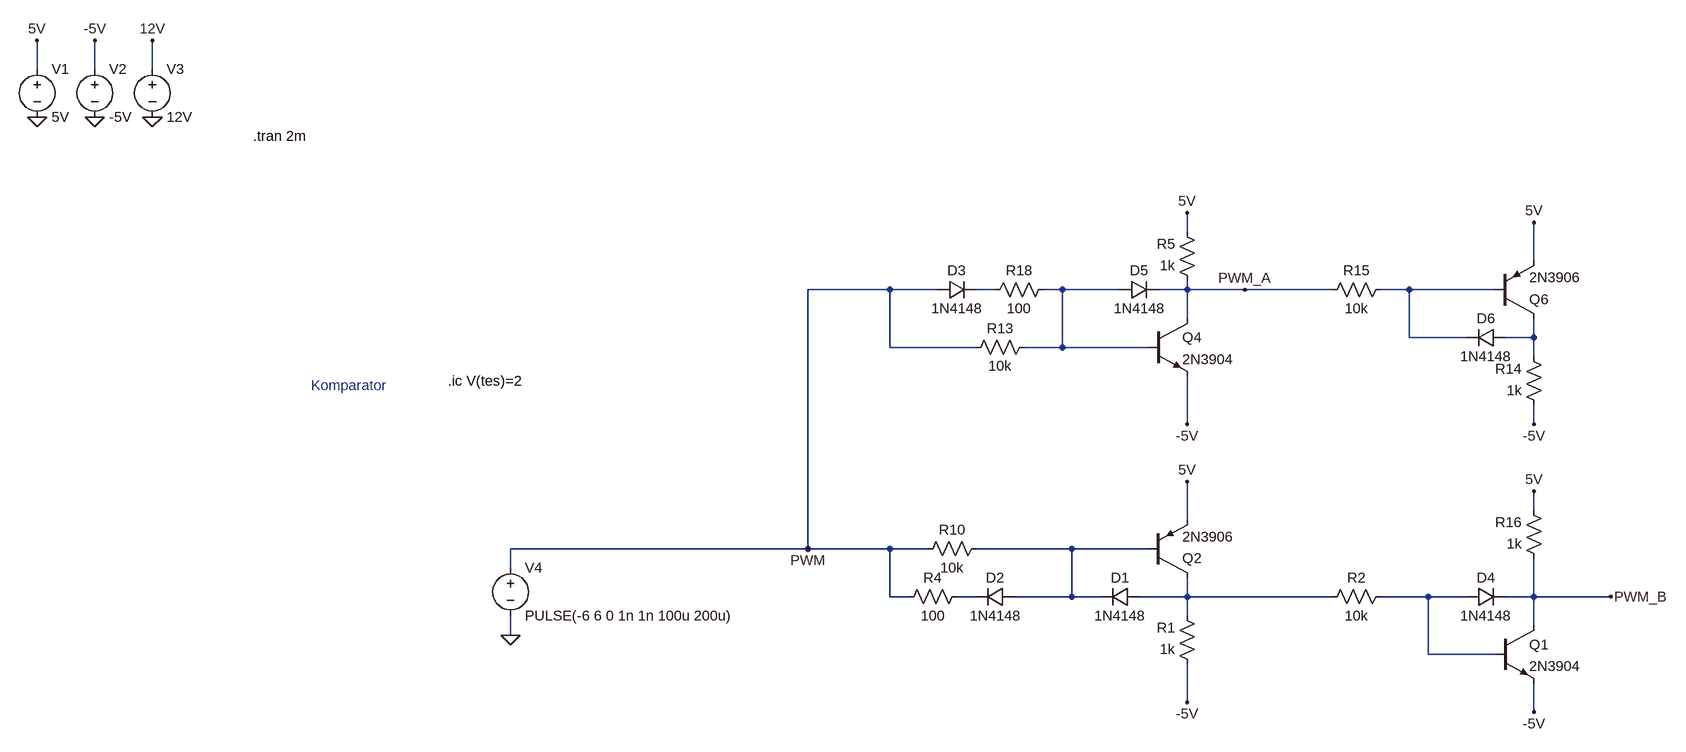
[diagram p0: schematic gate_drivers.asc]
gate_drivers.asc, the LTspice schematic file:
Version 4
SHEET 1 6380 2180
WIRE -1152 -816 -1152 -864
WIRE -1056 -816 -1056 -864
WIRE -960 -816 -960 -864
WIRE 1632 -544 1632 -576
WIRE 2320 -496 2320 -560
WIRE 1136 -448 880 -448
WIRE 1216 -448 1136 -448
WIRE 1312 -448 1280 -448
WIRE 1424 -448 1392 -448
WIRE 1520 -448 1424 -448
WIRE 1632 -448 1632 -464
WIRE 1632 -448 1584 -448
WIRE 1728 -448 1632 -448
WIRE 1984 -448 1728 -448
WIRE 2112 -448 2064 -448
WIRE 2256 -448 2112 -448
WIRE 1632 -400 1632 -448
WIRE 2112 -368 2112 -448
WIRE 2208 -368 2112 -368
WIRE 2320 -368 2320 -400
WIRE 2320 -368 2272 -368
WIRE 1136 -352 1136 -448
WIRE 1280 -352 1136 -352
WIRE 1424 -352 1424 -448
WIRE 1424 -352 1360 -352
WIRE 1568 -352 1424 -352
WIRE 2320 -336 2320 -368
WIRE 1632 -224 1632 -304
WIRE 2320 -224 2320 -256
WIRE 2320 -80 2320 -112
WIRE 1632 -64 1632 -128
WIRE 880 -16 880 -448
WIRE 880 -16 384 -16
WIRE 1136 -16 880 -16
WIRE 1200 -16 1136 -16
WIRE 1440 -16 1280 -16
WIRE 1568 -16 1440 -16
WIRE 384 16 384 -16
WIRE 1136 64 1136 -16
WIRE 1168 64 1136 64
WIRE 1280 64 1248 64
WIRE 1440 64 1440 -16
WIRE 1440 64 1344 64
WIRE 1488 64 1440 64
WIRE 1632 64 1632 32
WIRE 1632 64 1552 64
WIRE 1984 64 1632 64
WIRE 2144 64 2064 64
WIRE 2208 64 2144 64
WIRE 2320 64 2320 0
WIRE 2320 64 2272 64
WIRE 2448 64 2320 64
WIRE 1632 96 1632 64
WIRE 2320 112 2320 64
WIRE 384 128 384 96
WIRE 2144 160 2144 64
WIRE 2256 160 2144 160
WIRE 1632 240 1632 176
WIRE 2320 256 2320 208
FLAG -1152 -736 0
FLAG -1152 -864 5V
FLAG -1056 -736 0
FLAG -1056 -864 -5V
FLAG -960 -736 0
FLAG -960 -864 12V
FLAG 2448 64 PWM_B
FLAG 880 -16 PWM
FLAG 2320 256 -5V
FLAG 2320 -112 5V
FLAG 1632 -224 -5V
FLAG 1632 -576 5V
FLAG 2320 -224 -5V
FLAG 2320 -560 5V
FLAG 1632 240 -5V
FLAG 1632 -128 5V
FLAG 1728 -448 PWM_A
FLAG 384 128 0
SYMBOL voltage -1152 -832 R0
WINDOW 123 0 0 Left 0
WINDOW 39 0 0 Left 0
SYMATTR InstName V1
SYMATTR Value 5V
SYMBOL voltage -1056 -832 R0
WINDOW 123 0 0 Left 0
WINDOW 39 0 0 Left 0
SYMATTR InstName V2
SYMATTR Value -5V
SYMBOL voltage -960 -832 R0
WINDOW 123 0 0 Left 0
WINDOW 39 0 0 Left 0
SYMATTR InstName V3
SYMATTR Value 12V
SYMBOL npn 2256 112 R0
SYMATTR InstName Q1
SYMATTR Value 2N3904
SYMBOL res 1296 -32 R90
WINDOW 0 0 56 VBottom 2
WINDOW 3 32 56 VTop 2
SYMATTR InstName R10
SYMATTR Value 10k
SYMBOL res 2336 16 R180
WINDOW 0 36 76 Left 2
WINDOW 3 36 40 Left 2
SYMATTR InstName R16
SYMATTR Value 1k
SYMBOL diode 1344 48 R90
WINDOW 0 0 32 VBottom 2
WINDOW 3 32 32 VTop 2
SYMATTR InstName D2
SYMATTR Value 1N4148
SYMBOL res 1264 48 R90
WINDOW 0 0 56 VBottom 2
WINDOW 3 32 56 VTop 2
SYMATTR InstName R4
SYMATTR Value 100
SYMBOL npn 1568 -400 R0
SYMATTR InstName Q4
SYMATTR Value 2N3904
SYMBOL res 1648 -448 R180
WINDOW 0 36 76 Left 2
WINDOW 3 36 40 Left 2
SYMATTR InstName R5
SYMATTR Value 1k
SYMBOL res 1376 -368 R90
WINDOW 0 0 56 VBottom 2
WINDOW 3 32 56 VTop 2
SYMATTR InstName R13
SYMATTR Value 10k
SYMBOL diode 1216 -432 R270
WINDOW 0 32 32 VTop 2
WINDOW 3 0 32 VBottom 2
SYMATTR InstName D3
SYMATTR Value 1N4148
SYMBOL res 1408 -464 R90
WINDOW 0 0 56 VBottom 2
WINDOW 3 32 56 VTop 2
SYMATTR InstName R18
SYMATTR Value 100
SYMBOL pnp 2256 -400 M180
SYMATTR InstName Q6
SYMATTR Value 2N3906
SYMBOL res 2336 -240 R180
WINDOW 0 36 76 Left 2
WINDOW 3 36 40 Left 2
SYMATTR InstName R14
SYMATTR Value 1k
SYMBOL res 2080 -464 R90
WINDOW 0 0 56 VBottom 2
WINDOW 3 32 56 VTop 2
SYMATTR InstName R15
SYMATTR Value 10k
SYMBOL pnp 1568 32 M180
SYMATTR InstName Q2
SYMATTR Value 2N3906
SYMBOL res 1648 192 R180
WINDOW 0 36 76 Left 2
WINDOW 3 36 40 Left 2
SYMATTR InstName R1
SYMATTR Value 1k
SYMBOL res 2080 48 R90
WINDOW 0 0 56 VBottom 2
WINDOW 3 32 56 VTop 2
SYMATTR InstName R2
SYMATTR Value 10k
SYMBOL diode 1552 48 R90
WINDOW 0 0 32 VBottom 2
WINDOW 3 32 32 VTop 2
SYMATTR InstName D1
SYMATTR Value 1N4148
SYMBOL diode 2208 80 R270
WINDOW 0 32 32 VTop 2
WINDOW 3 0 32 VBottom 2
SYMATTR InstName D4
SYMATTR Value 1N4148
SYMBOL diode 1520 -432 R270
WINDOW 0 32 32 VTop 2
WINDOW 3 0 32 VBottom 2
SYMATTR InstName D5
SYMATTR Value 1N4148
SYMBOL diode 2272 -384 R90
WINDOW 0 0 32 VBottom 2
WINDOW 3 32 32 VTop 2
SYMATTR InstName D6
SYMATTR Value 1N4148
SYMBOL voltage 384 0 R0
WINDOW 123 0 0 Left 0
WINDOW 39 0 0 Left 0
SYMATTR InstName V4
SYMATTR Value PULSE(-6 6 0 1n 1n 100u 200u)
TEXT -680 -704 Left 2 !.tran 2m
TEXT 280 -296 Left 2 !.ic V(tes)=2
TEXT -584 -288 Left 2 ;Komparator

The netlist it stands for:
* gate_drivers.asc
V1 5V 0 5V
V2 -5V 0 -5V
V3 12V 0 12V
Q1 PWM_B N008 -5V 0 2N3904
R10 N005 PWM 10k
R16 PWM_B 5V 1k
D2 N005 N006 1N4148
R4 N006 PWM 100
Q4 PWM_A N002 -5V 0 2N3904
R5 PWM_A 5V 1k
R13 N002 PWM 10k
D3 PWM N001 1N4148
R18 N002 N001 100
Q6 N004 N003 5V 0 2N3906
R14 -5V N004 1k
R15 N003 PWM_A 10k
Q2 N007 N005 5V 0 2N3906
R1 -5V N007 1k
R2 N008 N007 10k
D1 N007 N005 1N4148
D4 N008 PWM_B 1N4148
D5 N002 PWM_A 1N4148
D6 N004 N003 1N4148
V4 PWM 0 PULSE(-6 6 0 1n 1n 100u 200u)
.model D D
.lib standard.dio
.model NPN NPN
.model PNP PNP
.lib standard.bjt
.tran 2m
.ic V(tes)=2
* Komparator
.backanno
.end